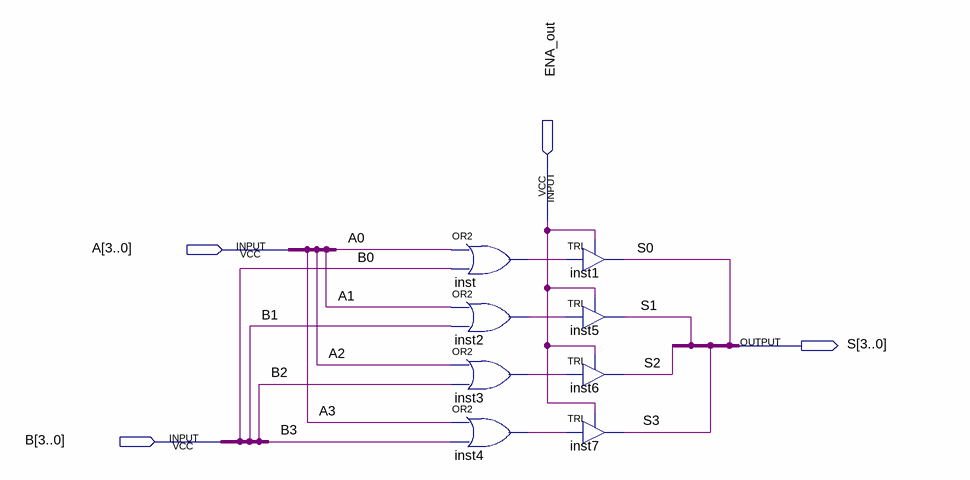
[diagram p0: schematic sheet]
// Quartus schematic or-arr4.bdf as structural Verilog: 8 symbols, 4 pins
module \or-arr4  (
  input  ENA_out,
  input  [3:0] A,
  input  [3:0] B,
  output [3:0] S
);

  wire inst2_out, inst3_out, inst4_out, inst_out;

  or inst (inst_out, A[0], B[0]);
  or inst2 (inst2_out, A[1], B[1]);
  or inst3 (inst3_out, A[2], B[2]);
  or inst4 (inst4_out, A[3], B[3]);
  TRI inst1 (.IN(inst_out), .OE(ENA_out), .OUT(S[0]));
  TRI inst5 (.IN(inst2_out), .OE(ENA_out), .OUT(S[1]));
  TRI inst6 (.IN(inst3_out), .OE(ENA_out), .OUT(S[2]));
  TRI inst7 (.IN(inst4_out), .OE(ENA_out), .OUT(S[3]));
endmodule
